# Altium schematic sheet connection.SchDoc
size OrCAD D; SheetNumber: 3; SheetTotal: 3
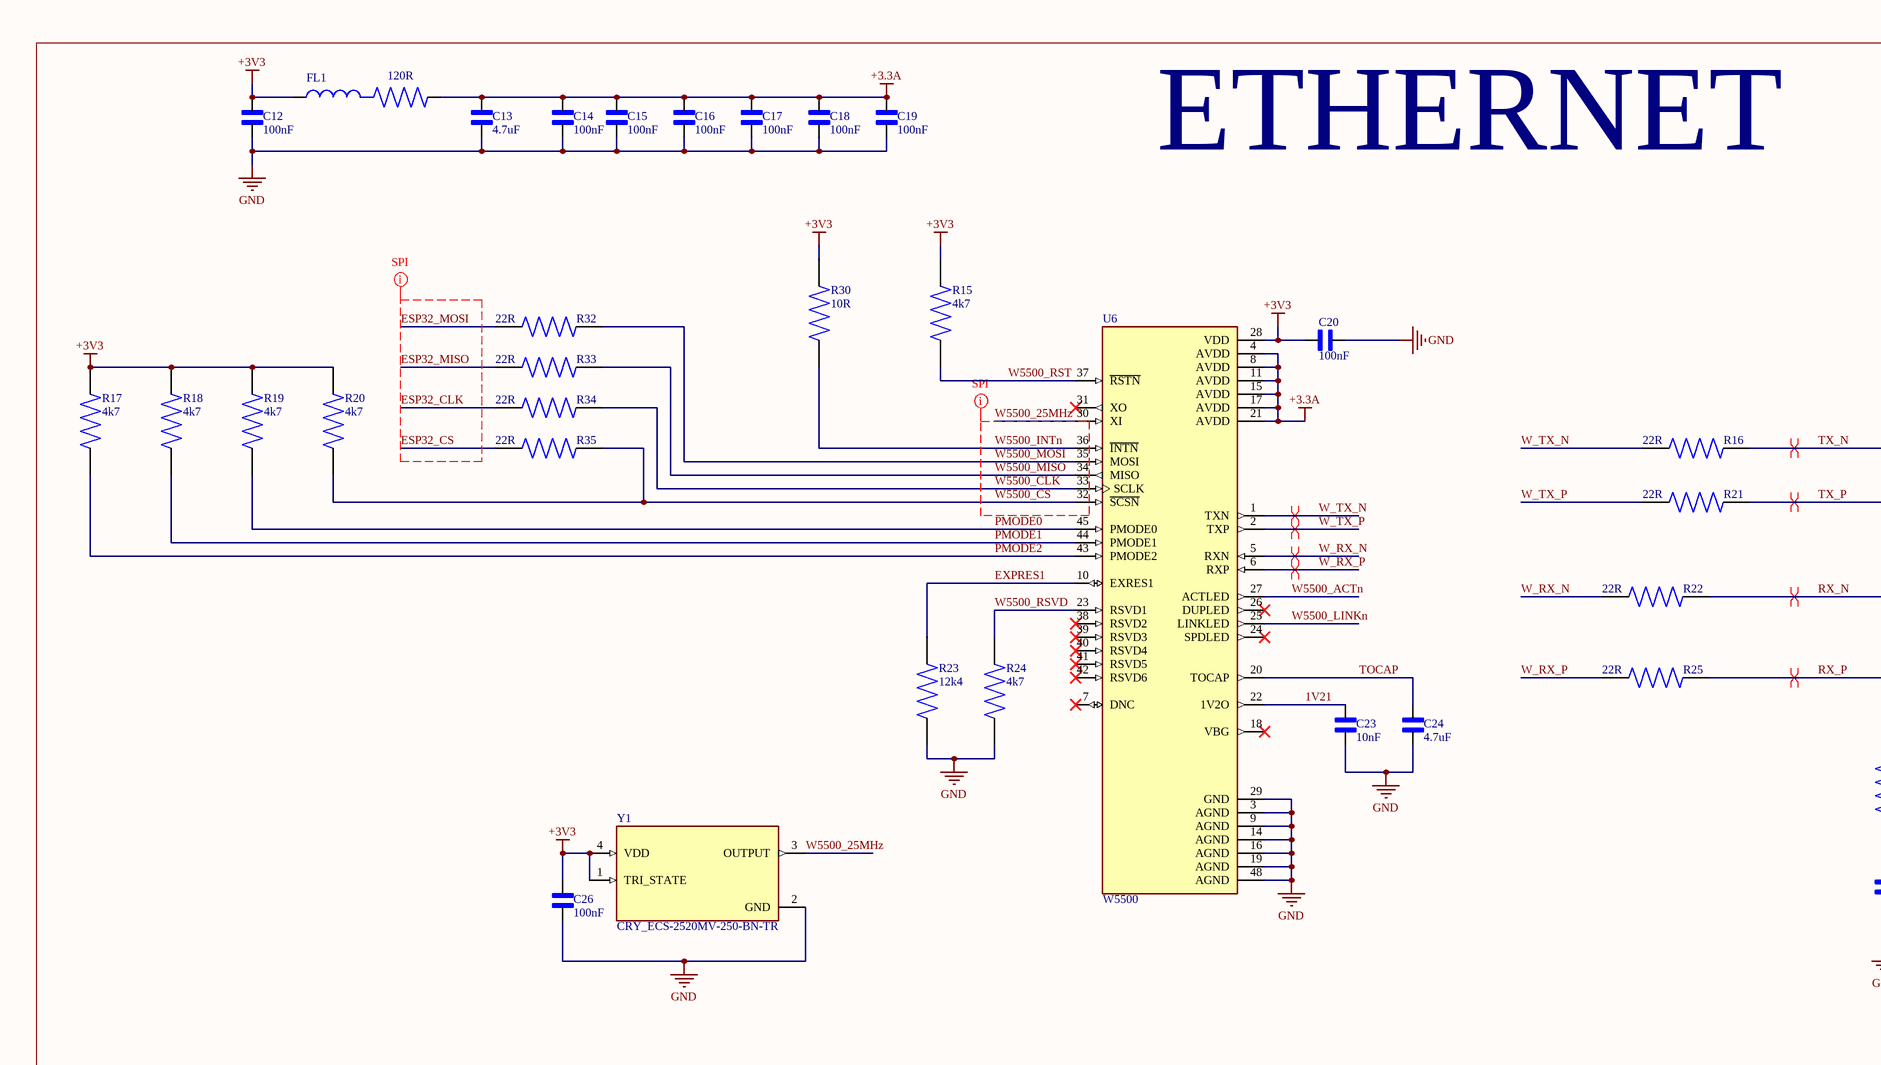
[diagram p0: connection.SchDoc, top left]
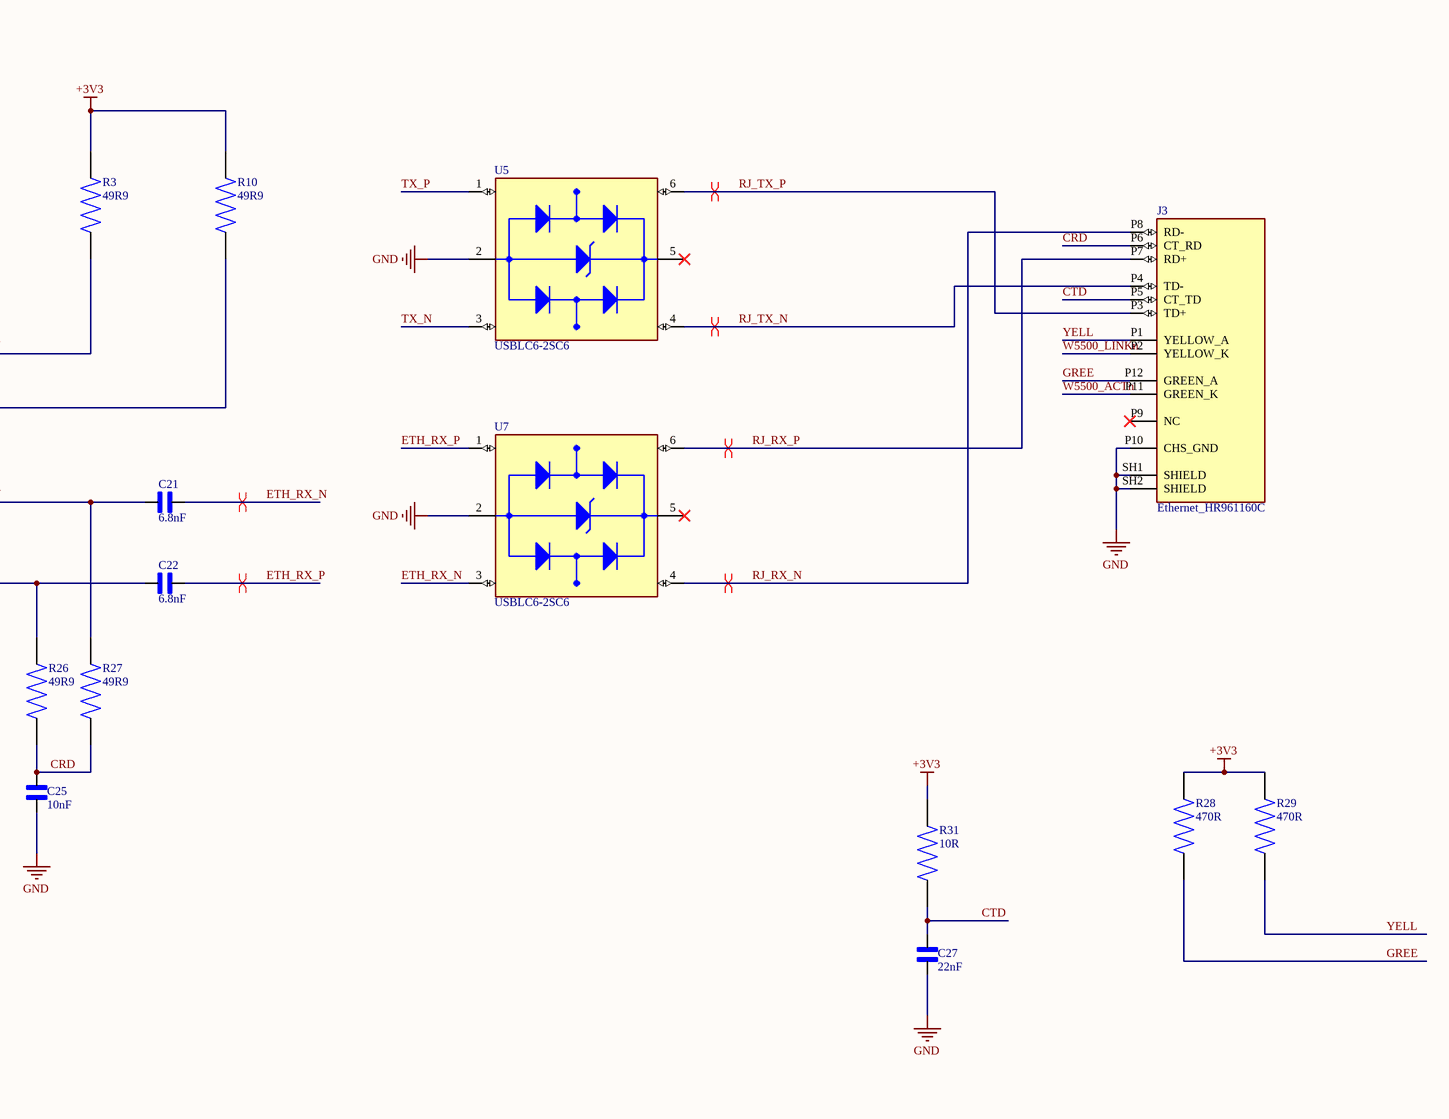
[diagram p1: connection.SchDoc, top middle]
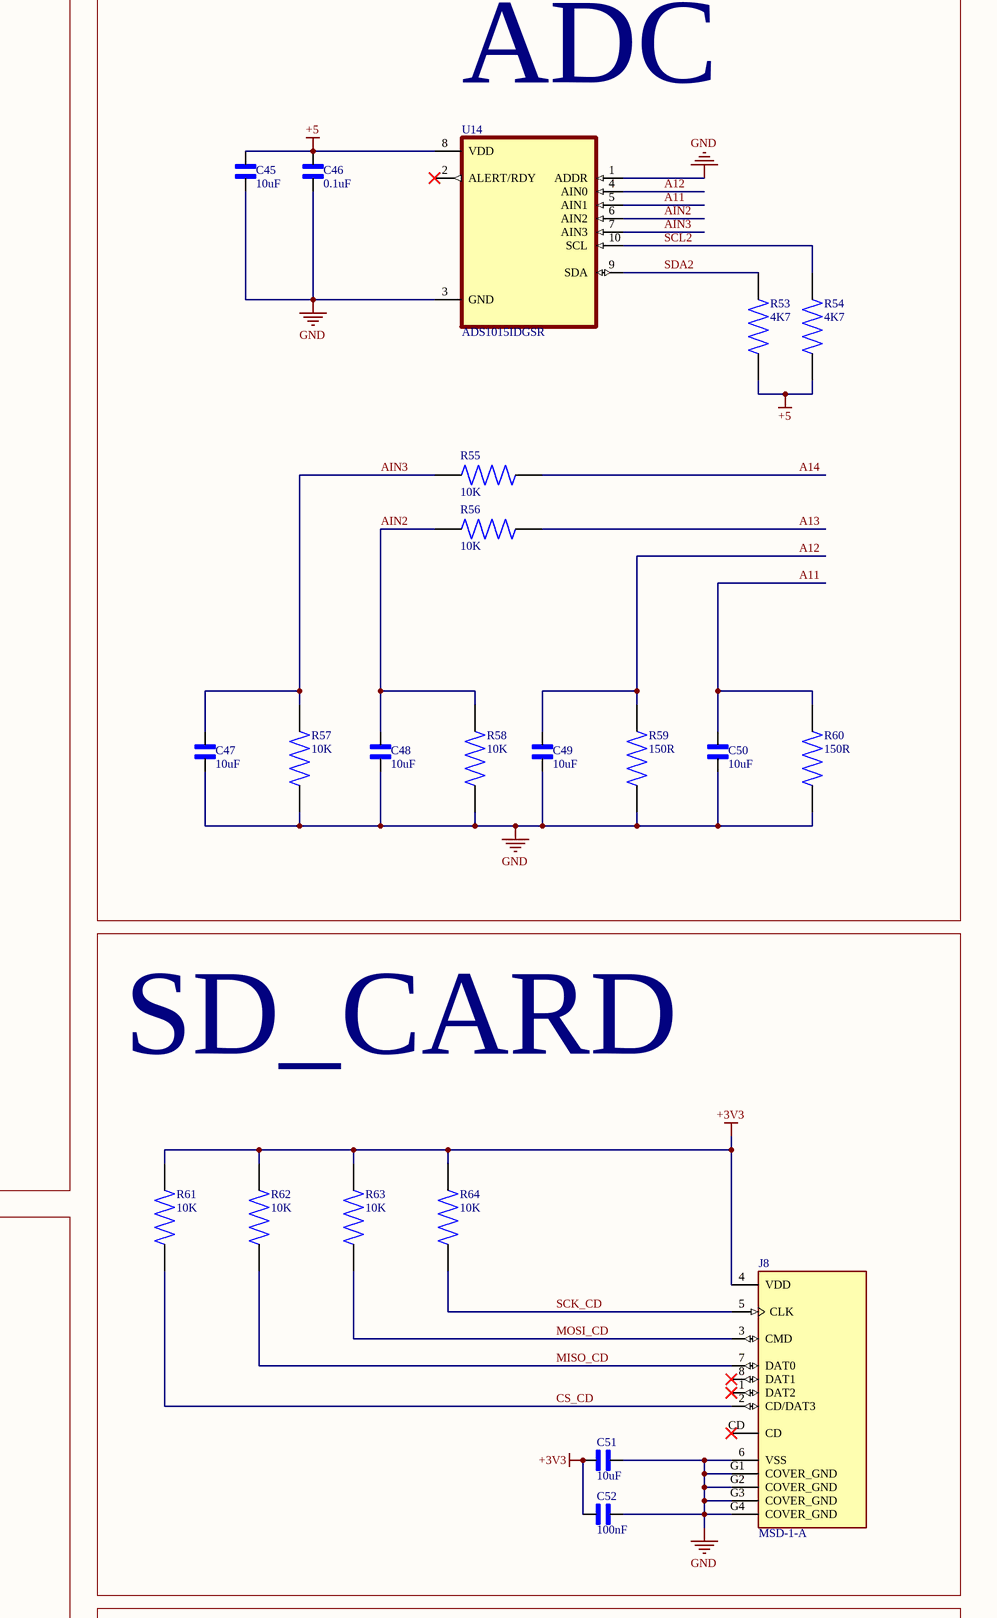
[diagram p2: connection.SchDoc, top right]
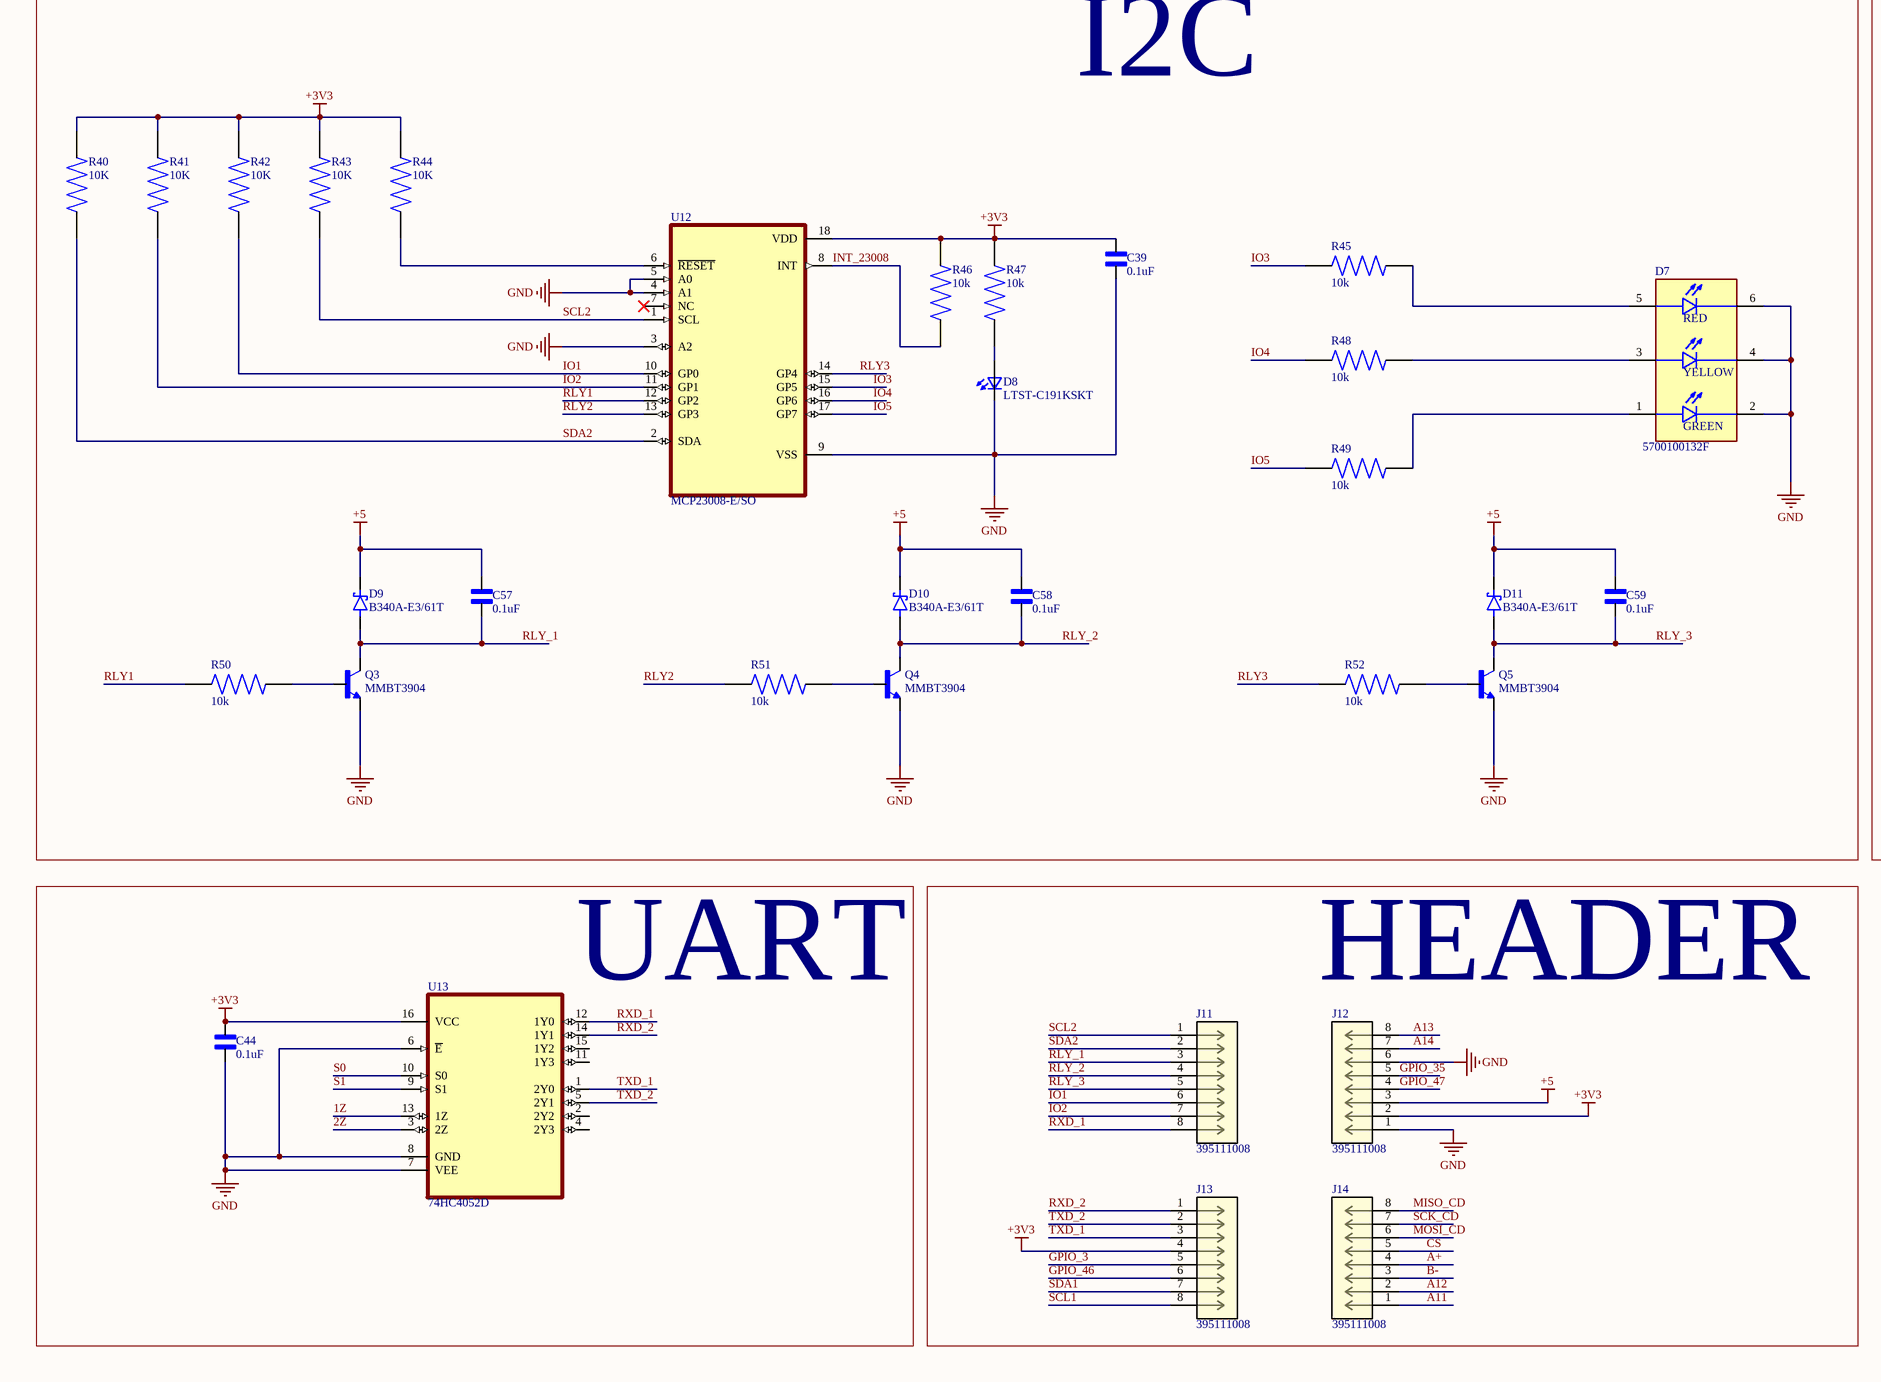
[diagram p3: connection.SchDoc, bottom left]
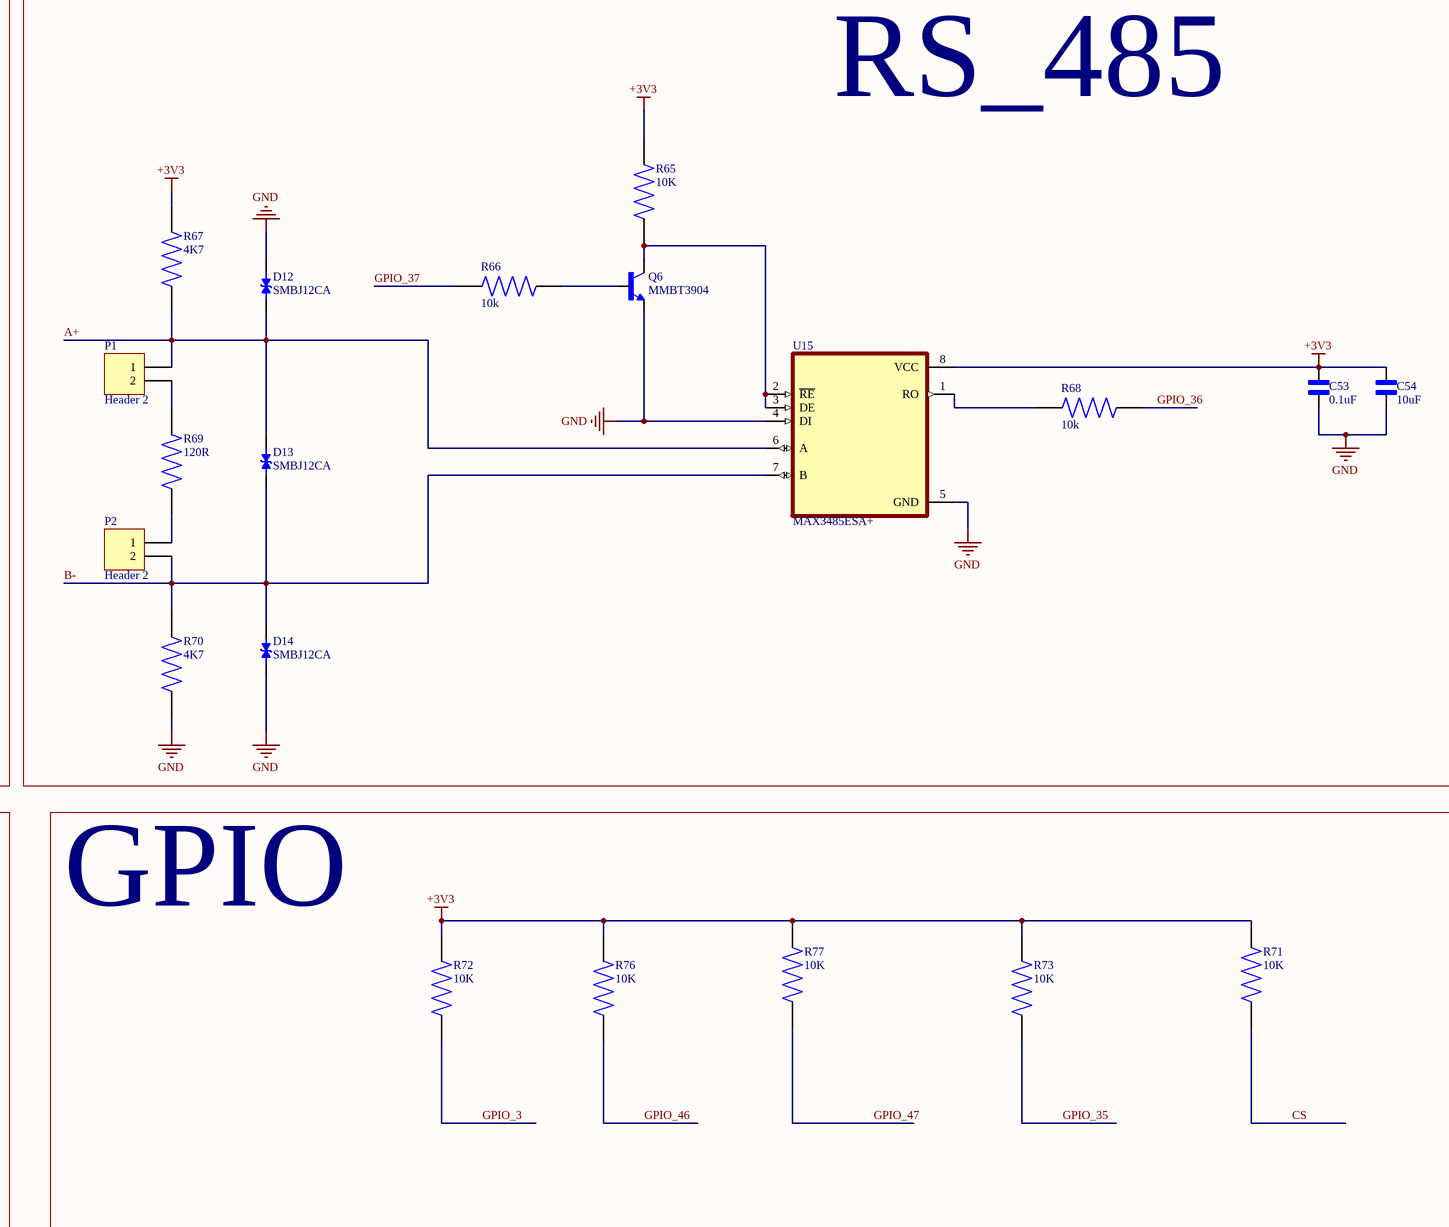
[diagram p4: connection.SchDoc, bottom middle]
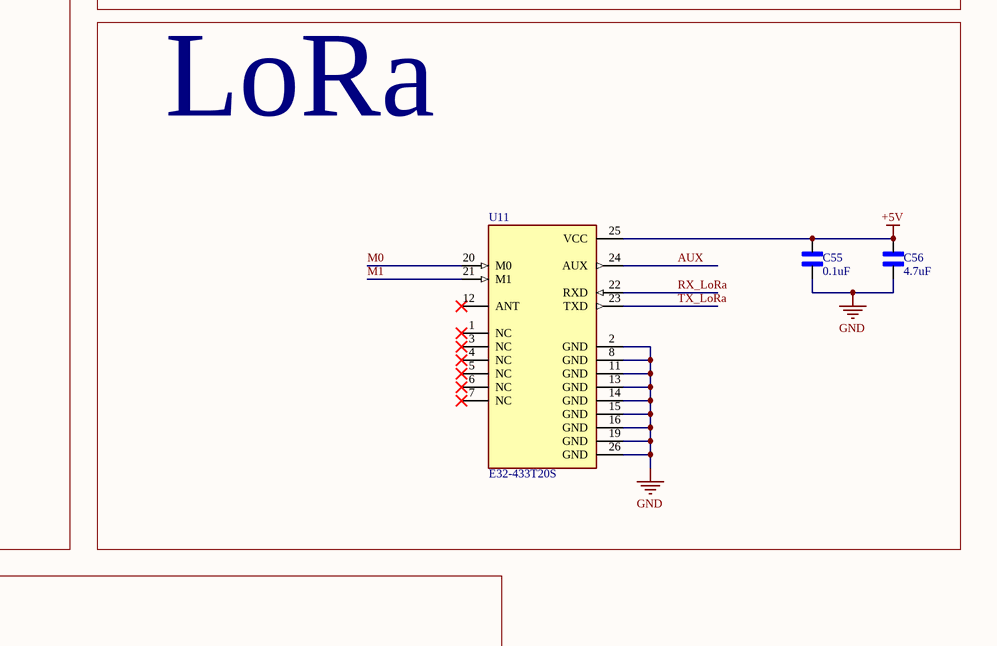
[diagram p5: connection.SchDoc, bottom right]

## Parts
C12  100nF  [CAPC1608X94N]
C13  4.7uF  [CAPC1608X94N]
C14  100nF  [CAPC1608X94N]
C15  100nF  [CAPC1608X94N]
C16  100nF  [CAPC1608X94N]
C17  100nF  [CAPC1608X94N]
C18  100nF  [CAPC1608X94N]
C19  100nF  [CAPC1608X94N]
C20  100nF  [CAPC1608X94N]
C21  6.8nF  [CAPC1608X94N]
C22  6.8nF  [CAPC1608X94N]
C23  10nF  [CAPC1608X94N]
C24  4.7uF  [CAPC1608X94N]
C25  10nF  [CAPC1608X94N]
C26  100nF  [CAPC1608X94N]
C27  22nF  [CAPC1608X94N]
C39  0.1uF  [CAPC1608X94N]
C44  0.1uF  [CAPC1608X94N]
C45  10uF  [CAPC1608X94N]
C46  0.1uF  [CAPC1608X94N]
C47  10uF  [CAPC1608X94N]
C48  10uF  [CAPC1608X94N]
C49  10uF  [CAPC1608X94N]
C50  10uF  [CAPC1608X94N]
C51  10uF  [CAPC1608X94N]
C52  100nF  [CAPC1608X94N]
C53  0.1uF  [CAPC1608X94N]
C54  10uF  [CAPC1608X94N]
C55  0.1uF  [CAPC1608X94N]
C56  4.7uF  [CAPC1608X94N]
C57  0.1uF  [CAPC1608X94N]
C58  0.1uF  [CAPC1608X94N]
C59  0.1uF  [CAPC1608X94N]
D7  5700100132F  [LED_5700100132F]
D8  LTST-C191KSKT  [0603]
D9  B340A-E3/61T  [DIOM5126X229N]
D10  B340A-E3/61T  [DIOM5126X229N]
D11  B340A-E3/61T  [DIOM5126X229N]
D12  SMBJ12CA  [DIOM4336X265N]
D13  SMBJ12CA  [DIOM4336X265N]
D14  SMBJ12CA  [DIOM4336X265N]
FL1  120R  [BEADC1608X95N]
J3  Ethernet_HR961160C  [HANRUN_HR961160C]
J8  MSD-1-A  [CUI_MSD-1-A]
J11  395111008  [terminal_block_8_male]
J12  395111008  [terminal_block_8_male]
J13  395111008  [terminal_block_8_male]
J14  395111008  [terminal_block_8_male]
P1  Header 2  [HDR1X2]
P2  Header 2  [HDR1X2]
Q3  MMBT3904  [TRANS_MMBT3904]
Q4  MMBT3904  [TRANS_MMBT3904]
Q5  MMBT3904  [TRANS_MMBT3904]
Q6  MMBT3904  [TRANS_MMBT3904]
R3  49R9  [RES_ERJU03J474V]
R10  49R9  [RES_ERJU03J474V]
R15  4k7  [RES_ERJU03J474V]
R16  22R  [RES_ERJU03J474V]
R17  4k7  [RES_ERJU03J474V]
R18  4k7  [RES_ERJU03J474V]
R19  4k7  [RES_ERJU03J474V]
R20  4k7  [RES_ERJU03J474V]
R21  22R  [RES_ERJU03J474V]
R22  22R  [RES_ERJU03J474V]
R23  12k4  [RES_ERJU03J474V]
R24  4k7  [RES_ERJU03J474V]
R25  22R  [RES_ERJU03J474V]
R26  49R9  [RES_ERJU03J474V]
R27  49R9  [RES_ERJU03J474V]
R28  470R  [RES_ERJU03J474V]
R29  470R  [RES_ERJU03J474V]
R30  10R  [RES_ERJU03J474V]
R31  10R  [RES_ERJU03J474V]
R32  22R  [RES_ERJU03J474V]
R33  22R  [RES_ERJU03J474V]
R34  22R  [RES_ERJU03J474V]
R35  22R  [RES_ERJU03J474V]
R40  10K  [RES_ERJU03J474V]
R41  10K  [RES_ERJU03J474V]
R42  10K  [RES_ERJU03J474V]
R43  10K  [RES_ERJU03J474V]
R44  10K  [RES_ERJU03J474V]
R45  10k  [RES_ERJU03J474V]
R46  10k  [RES_ERJU03J474V]
R47  10k  [RES_ERJU03J474V]
R48  10k  [RES_ERJU03J474V]
R49  10k  [RES_ERJU03J474V]
R50  10k  [RES_ERJU03J474V]
R51  10k  [RES_ERJU03J474V]
R52  10k  [RES_ERJU03J474V]
R53  4K7  [RES_ERJU03J474V]
R54  4K7  [RES_ERJU03J474V]
R55  10K  [RES_ERJU03J474V]
R56  10K  [RES_ERJU03J474V]
R57  10K  [RES_ERJU03J474V]
R58  10K  [RES_ERJU03J474V]
R59  150R  [RES_ERJU03J474V]
R60  150R  [RES_ERJU03J474V]
R61  10K  [RES_ERJU03J474V]
R62  10K  [RES_ERJU03J474V]
R63  10K  [RES_ERJU03J474V]
R64  10K  [RES_ERJU03J474V]
R65  10K  [RES_ERJU03J474V]
R66  10k  [RES_ERJU03J474V]
R67  4K7  [RES_ERJU03J474V]
R68  10k  [RES_ERJU03J474V]
R69  120R  [RES_ERJU03J474V]
R70  4K7  [RES_ERJU03J474V]
R71  10K  [RES_ERJU03J474V]
R72  10K  [RES_ERJU03J474V]
R73  10K  [RES_ERJU03J474V]
R76  10K  [RES_ERJU03J474V]
R77  10K  [RES_ERJU03J474V]
U5  USBLC6-2SC6  [USBLC6-2SC6]
U6  W5500  [QFP50P900X900X160-48N]
U7  USBLC6-2SC6  [USBLC6-2SC6]
U11  E32-433T20S  [MODULE_E32-433T20S]
U12  MCP23008-E/SO  [SOIC127P1030X265-18N]
U13  74HC4052D  [SOIC127P600X175-16N]
U14  ADS1015IDGSR  [SOP50P490X110-10N]
U15  MAX3485ESA+  [SOIC127P600X175-8N]
Y1  CRY_ECS-2520MV-250-BN-TR  [OSC_ECS-2520S25-250-FN-TR]

## Blocks framed on the sheet
ETHERNET: C12-C27 FL1 J3 R3 R10 R15-R35 U5-U7 Y1
ADC: C45-C50 R53-R60 U14
SD_CARD: C51 C52 J8 R61-R64
I2C: C39 C57-C59 D7-D11 Q3-Q5 R40-R52 U12
RS_485: C53 C54 D12-D14 P1 P2 Q6 R65-R70 U15
LoRa: C55 C56 U11
UART: C44 U13
HEADER: J11-J14
GPIO: R71-R73 R76 R77

## Nets
+3.3A: C13.1 C14.1 C15.1 C16.1 C17.1 C18.1 C19.1 FL1.2 U6.4(AVDD) U6.8(AVDD) U6.11(AVDD) U6.15(AVDD) U6.17(AVDD) U6.21(AVDD)
+3V3: C12.1 C20.1 C26.1 C39.2 C44.2 C51.2 C52.2 C53.2 C54.2 FL1.1 J8.4(VDD) J12.2 J13.4 R3.2 R10.2 R15.1 R17.1 R18.1 R19.1 R20.1 R28.2 R29.2 R30.2 R31.2 R40.2 R41.2 R42.2 R43.2 R44.2 R46.2 R47.2 R61.1 R62.1 R63.1 R64.1 R65.1 R67.2 R71.1 R72.1 R73.1 R76.1 R77.1 U6.28(VDD) U12.18(VDD) U13.16(VCC) U15.8(VCC) Y1.1(TRI_STATE) Y1.4(VDD)
+5: C45.2 C46.2 C57.2 C58.2 C59.2 D9.C D10.C D11.C J12.3 R53.2 R54.2 U14.8(VDD)
+5V: C55.2 C56.2 U11.25(VCC)
GND: C12.2 C13.2 C14.2 C15.2 C16.2 C17.2 C18.2 C19.2 C20.2 C23.2 C24.2 C25.1 C26.2 C27.1 C39.1 C44.1 C45.1 C46.1 C47.1 C48.1 C49.1 C50.1 C51.1 C52.1 C53.1 C54.1 C55.1 C56.1 D7.2(C_GREEN) D7.4(C_YELLOW) D7.6(C_RED) D8.1(K2) D12.2 D14.1 J3.P10(CHS_GND) J3.SH1(SHIELD) J3.SH2(SHIELD) J8.6(VSS) J8.G1(COVER_GND) J8.G2(COVER_GND) J8.G3(COVER_GND) J8.G4(COVER_GND) J12.1 J12.6 Q3.2(E) Q4.2(E) Q5.2(E) Q6.2(E) R23.2 R24.2 R57.2 R58.2 R59.2 R60.2 R70.1 U5.2(GND) U6.3(AGND) U6.9(AGND) U6.14(AGND) U6.16(AGND) U6.19(AGND) U6.29(GND) U6.48(AGND) U7.2(GND) U11.2(GND) U11.8(GND) U11.11(GND) U11.13(GND) U11.14(GND) U11.15(GND) U11.16(GND) U11.19(GND) U11.26(GND) U12.3(A2) U12.4(A1) U12.5(A0) U12.9(VSS) U13.6(~{E}) U13.7(VEE) U13.8(GND) U14.1(ADDR) U14.3(GND) U15.4(DI) U15.5(GND) Y1.2(GND)
1V21: C23.1 U6.22(1V2O)
1Z: U13.13(1Z)
2Z: U13.3(2Z)
A11: C50.2 J14.1 R60.1 U14.5(AIN1)
A12: C49.2 J14.2 R59.1 U14.4(AIN0)
A13: J12.8 R56.1
A14: J12.7 R55.1
A+: D12.1 D13.2 J14.4 P1.1 R67.1 U15.6(A)
AIN2: C48.2 R56.2 R58.1 U14.6(AIN2)
AIN3: C47.2 R55.2 R57.1 U14.7(AIN3)
AUX: U11.24(AUX)
B-: D13.1 D14.2 J14.3 P2.2 R70.2 U15.7(B)
CRD: C25.2 J3.P6(CT_RD) R26.1 R27.1
CS: J14.5 R71.2
CS_CD: J8.2(CD/DAT3) R61.2
CTD: C27.2 J3.P5(CT_TD) R31.1
ESP32_CLK: R34.1
ESP32_CS: R35.1
ESP32_MISO: R33.1
ESP32_MOSI: R32.1
ETH_RX_N: C21.2 U7.3(I/O2_IN)
ETH_RX_P: C22.2 U7.1(I/O1_IN)
EXPRES1: R23.1 U6.10(EXRES1)
GPIO_3: J13.5 R72.2
GPIO_35: J12.5 R73.2
GPIO_36: R68.2
GPIO_37: R66.2
GPIO_46: J13.6 R76.2
GPIO_47: J12.4 R77.2
GREE: J3.P12(GREEN_A) R28.1
INT_23008: R46.1 U12.8(INT)
IO1: J11.6 R42.1 U12.10(GP0)
IO2: J11.7 R41.1 U12.11(GP1)
IO3: R45.2 U12.15(GP5)
IO4: R48.2 U12.16(GP6)
IO5: R49.2 U12.17(GP7)
M0: U11.20(M0)
M1: U11.21(M1)
MISO_CD: J8.7(DAT0) J14.8 R62.2
MOSI_CD: J8.3(CMD) J14.6 R63.2
PMODE0: R19.2 U6.45(PMODE0)
PMODE1: R18.2 U6.44(PMODE1)
PMODE2: R17.2 U6.43(PMODE2)
RJ_RX_N: J3.P8(RD-) U7.4(I/O2_OUT)
RJ_RX_P: J3.P7(RD+) U7.6(I/O1_OUT)
RJ_TX_N: J3.P4(TD-) U5.4(I/O2_OUT)
RJ_TX_P: J3.P3(TD+) U5.6(I/O1_OUT)
RLY1: R50.1 U12.12(GP2)
RLY2: R51.1 U12.13(GP3)
RLY3: R52.1 U12.14(GP4)
RLY_1: C57.1 D9.A J11.3 Q3.3(C)
RLY_2: C58.1 D10.A J11.4 Q4.3(C)
RLY_3: C59.1 D11.A J11.5 Q5.3(C)
RX_LoRa: U11.22(RXD)
RX_N: C21.1 R22.2 R27.2
RX_P: C22.1 R25.2 R26.2
RXD_1: J11.8 U13.12(1Y0)
RXD_2: J13.1 U13.14(1Y1)
S0: U13.10(S0)
S1: U13.9(S1)
SCK_CD: J8.5(CLK) J14.7 R64.2
SCL1: J13.8
SCL2: J11.1 R43.1 R54.1 U12.1(SCL) U14.10(SCL)
SDA1: J13.7
SDA2: J11.2 R40.1 R53.1 U12.2(SDA) U14.9(SDA)
TOCAP: C24.1 U6.20(TOCAP)
TX_LoRa: U11.23(TXD)
TX_N: R3.1 R16.2 U5.3(I/O2_IN)
TX_P: R10.1 R21.2 U5.1(I/O1_IN)
TXD_1: J13.3 U13.1(2Y0)
TXD_2: J13.2 U13.5(2Y1)
W5500_25MHz: U6.30(XI) Y1.3(OUTPUT)
W5500_ACTn: J3.P11(GREEN_K) U6.27(ACTLED)
W5500_CLK: R34.2 U6.33(SCLK)
W5500_CS: R20.2 R35.2 U6.32(~{SCSN})
W5500_INTn: R30.1 U6.36(~{INTN})
W5500_LINKn: J3.P2(YELLOW_K) U6.25(LINKLED)
W5500_MISO: R33.2 U6.34(MISO)
W5500_MOSI: R32.2 U6.35(MOSI)
W5500_RST: R15.2 U6.37(~{RSTN})
W5500_RSVD: R24.1 U6.23(RSVD1)
W_RX_N: R22.1 U6.5(RXN)
W_RX_P: R25.1 U6.6(RXP)
W_TX_N: R16.1 U6.1(TXN)
W_TX_P: R21.1 U6.2(TXP)
YELL: J3.P1(YELLOW_A) R29.1
NetD7_1: D7.1(A_GREEN) R49.1
NetD7_3: D7.3(A_YELLOW) R48.1
NetD7_5: D7.5(A_RED) R45.1
NetD8_2: D8.2(A2) R47.1
NetP1_2: P1.2 R69.2
NetP2_1: P2.1 R69.1
NetQ3_1: Q3.1(B) R50.2
NetQ4_1: Q4.1(B) R51.2
NetQ5_1: Q5.1(B) R52.2
NetQ6_1: Q6.1(B) R66.1
NetQ6_3: Q6.3(C) R65.2 U15.2(~{RE}) U15.3(DE)
NetR44_1: R44.1 U12.6(~{RESET})
NetR68_1: R68.1 U15.1(RO)

Not connected (* = marked no-connect by the designer): J3 P9(NC)*; J8 1(DAT2)* 8(DAT1)* CD*; U5 5(VBUS)*; U6 7(DNC)* 18(VBG)* 24(SPDLED)* 26(DUPLED)* 31(XO)* 38(RSVD2)* 39(RSVD3)* 40(RSVD4)* 41(RSVD5)* 42(RSVD6)*; U7 5(VBUS)*; U11 1(NC)* 3(NC)* 4(NC)* 5(NC)* 6(NC)* 7(NC)* 12(ANT)*; U12 7(NC)*; U13 2(2Y2) 4(2Y3) 11(1Y3) 15(1Y2); U14 2(ALERT/RDY)*

## Layout directives
differential pair: ETH_RX_N, ETH_RX_P, RJ_RX_N, RJ_RX_P, RJ_TX_N, RJ_TX_P, RX_N, RX_P, TX_N, TX_P, W_RX_N, W_RX_P, W_TX_N, W_TX_P
mark named SPI: ESP32_CLK, ESP32_CS, ESP32_MISO, ESP32_MOSI, W5500_25MHz, W5500_CLK, W5500_CS, W5500_INTn, W5500_MISO, W5500_MOSI

## Notes on the sheet
- (in symbol 5700100132F) RED; YELLOW; GREEN

## Library data of the parts
C12-C27 C39 C44-C59 = cap_0603_VJ0603D3R9DXCAP: cap 0603 (1608 Metric); MF: Vishay Vitramon; SnapEDA_Link: https://www.snapeda.com/parts/VJ0603D3R9DXCAP/Vishay/view-part/?ref=snap; Package: 1608 Vishay Vitramon; Value: *; MP: VJ0603D3R9DXCAP; Check_prices: https://www.snapeda.com/parts/VJ0603D3R9DXCAP/Vishay/view-part/?ref=eda
D7 = 5700100132F: Indicator,LED PCB Thru-Hole Bulb 2 mm Red/Yellow/Green Diffused, Tinted Round | Dialight 570-0100-132F; SnapEDA_Link: https://www.snapeda.com/parts/570-0100-132F/Dialight/view-part/?ref=snap; Package: D2PAK Dialight; Value: *; MF: Dialight; MP: 570-0100-132F; Check_prices: https://www.snapeda.com/parts/570-0100-132F/Dialight/view-part/?ref=eda
D8 = LTST-C191KSKT: Yellow 591nm LED Indication - Discrete 2.1V 0603 (1608 Metric); MF: Lite-On Inc.; SnapEDA_Link: https://www.snapeda.com/parts/LTST-C191KSKT/Lite-On/view-part/?ref=snap; Package: 0603 Lite-On Inc.; Value: *; MP: LTST-C191KSKT; Check_prices: https://www.snapeda.com/parts/LTST-C191KSKT/Lite-On/view-part/?ref=eda
D9-D11 = B340A-E3/61T: Diode Schottky 40 V 3A Surface Mount DO-214AC (SMA); MF: Vishay Semiconductor; SnapEDA_Link: https://www.snapeda.com/parts/B340A-E3/61T/Vishay/view-part/?ref=snap; Package: DO-214 Vishay Semiconductor; Value: *; MP: B340A-E3/61T; Check_prices: https://www.snapeda.com/parts/B340A-E3/61T/Vishay/view-part/?ref=eda
D12-D14 = SMBJ10CA-13-F: MF: {'manufacturer': u'Diodes Incorporated'}; Package: None; Price: None; Value: *; MP: SMBJ10CA-13-F; Availability: Unavailable
FL1 = ferrite bead 0603: MP: BLM18BD421SZ1D; Package: None; Price: None; Value: *; Availability: Unavailable
J3 = Ethernet_HR961160C: 1x1 Port Tab-UP Surface Mount RJ45 Connector with Magnetics Module and LEDfor 10/100Base-TX NIC Applications.; MF: HanRun; SnapEDA_Link: https://www.snapeda.com/parts/HR961160C/HanRun/view-part/?ref=snap; Package: Package; Value: *; MP: HR961160C; Check_prices: https://www.snapeda.com/parts/HR961160C/HanRun/view-part/?ref=eda
J8 = MSD-1-A: Micro SD Card Connector, 9 Positions, Connector and Ejector, Push In, Auto Eject Out, Surface Mount, 1.8 mm Height Above Board, Gold Flash; MF: Same Sky; SnapEDA_Link: https://www.snapeda.com/parts/MSD-1-A/Same+Sky/view-part/?ref=snap; Package: None; Value: *; MP: MSD-1-A; Check_prices: https://www.snapeda.com/parts/MSD-1-A/Same+Sky/view-part/?ref=eda
J11-J14 = 395111008_terminal_block: 3.81mm Pitch Eurostyle Vertical PCB Header, 8 Circuits; Manufacturer_Name: Molex Connector Corporation; Copyright: Copyright (C) 2025 Ultra Librarian. All rights reserved.; Manufacturer_Part_Number: 395111008; RefDes: RefDes; Type: Type
P1 P2 = Header 2: Header, 2-Pin; LatestRevisionDate: 17-Jul-2002; LatestRevisionNote: Re-released for DXP Platform.; Publisher: Altium Limited
Q3-Q6 = MMBT3904: BJT, SOT-23, 40V, 200mA, NPN, 0.35W, 150Â°C; MF: Diotec Semiconductor; SnapEDA_Link: https://www.snapeda.com/parts/MMBT3904/Diotec/view-part/?ref=snap; Package: SOT-23 Diotec; Value: *; MP: MMBT3904; Check_prices: https://www.snapeda.com/parts/MMBT3904/Diotec/view-part/?ref=eda
R3 R10 R15-R35 R40-R73 R76 R77 = res_0603_ERJU03J474V: 0603 Anti-Sulfurated; MF: Panasonic; SnapEDA_Link: https://www.snapeda.com/parts/ERJU03J474V/Panasonic/view-part/?ref=snap; Package: 1608-2 Panasonic; Value: *; MP: ERJU03J474V; Check_prices: https://www.snapeda.com/parts/ERJU03J474V/Panasonic/view-part/?ref=eda
U5 U7 = USBLC6-2SC6: 17V Clamp 5A (8/20Âµs) Ipp Tvs Diode Surface Mount SOT-23-6; MF: STMicroelectronics; Value: *; SnapEDA_Link: https://www.snapeda.com/parts/USBLC6-2SC6/STMicroelectronics/view-part/?ref=snap; Check_prices: https://www.snapeda.com/parts/USBLC6-2SC6/STMicroelectronics/view-part/?ref=eda; Purchase-URL: https://pricing.snapeda.com/search/part/USBLC6-2SC6/?ref=eda; Price: None; Availability: In Stock; Package: SOT-23-6 STMicroelectronics; MP: USBLC6-2SC6
U6 = W5500: Hardwired TCP/IP embedded Ethernet controller; Availability: Unavailable; MP: W5500; Value: *; Price: None; Package: None
U11 = E32-433T20S: Wireless serial port module (UART); MF: EBYTE; Check_prices: https://www.snapeda.com/parts/E32-433T20S/EBYTE/view-part/?ref=eda; Package: Package; MP: E32-433T20S; Value: *; SnapEDA_Link: https://www.snapeda.com/parts/E32-433T20S/EBYTE/view-part/?ref=snap; Price: None; Availability: Not in stock
U12 = MCP23008-E/SO: 8-BIT INPUT/OUTPUT EXPANDER, I2C INTERFACE | Microchip Technology Inc. MCP23008-E/SO; SnapEDA_Link: https://www.snapeda.com/parts/MCP23008-E/SO/Microchip+Technology/view-part/?ref=snap; Package: SOIC-18 Microchip; Value: *; MF: Microchip; MP: MCP23008-E/SO; Check_prices: https://www.snapeda.com/parts/MCP23008-E/SO/Microchip+Technology/view-part/?ref=eda
U13 = 74HC4052D: 2 Circuit IC Switch 4:1 130Ohm 16-SOIC; MF: Toshiba; SnapEDA_Link: https://www.snapeda.com/parts/74HC4052D/Toshiba/view-part/?ref=snap; Package: SOIC-16 NXP Semiconductors; Value: *; MP: 74HC4052D; Check_prices: https://www.snapeda.com/parts/74HC4052D/Toshiba/view-part/?ref=eda
U14 = ADS1015IDGSR: 12-bit, 3.3-kSPS, 4-channel, delta-sigma ADC with PGA, oscillator, VREF, comparator and I2C; MF: Texas Instruments; SnapEDA_Link: https://www.snapeda.com/parts/ADS1015IDGSR/Texas+Instruments/view-part/?ref=snap; Package: VSSOP-10 Texas Instruments; Value: *; MP: ADS1015IDGSR; Check_prices: https://www.snapeda.com/parts/ADS1015IDGSR/Texas+Instruments/view-part/?ref=eda
U15 = MAX3485ESA+: 3.3V Powered, 10Mbps and Slew-Rate Limited, True RS-485/RS-422 Transceivers; MF: Analog Devices; SnapEDA_Link: https://www.snapeda.com/parts/MAX3485ESA+/Analog+Devices/view-part/?ref=snap; Package: SOIC-8 Maxim; Value: *; MP: MAX3485ESA+; Check_prices: https://www.snapeda.com/parts/MAX3485ESA+/Analog+Devices/view-part/?ref=eda
Y1 = CRY_ECS-2520MV-250-BN-TR: 25 MHz XO (Standard) HCMOS Oscillator 1.6V ~ 3.6V Enable/Disable 4-SMD, No Lead; MF: ECS Inc.; SnapEDA_Link: https://www.snapeda.com/parts/ECS-2520MV-250-BN-TR/ECS/view-part/?ref=snap; Package: ECS-2520MV-0-4 ECS; Value: *; MP: ECS-2520MV-250-BN-TR; Check_prices: https://www.snapeda.com/parts/ECS-2520MV-250-BN-TR/ECS/view-part/?ref=eda